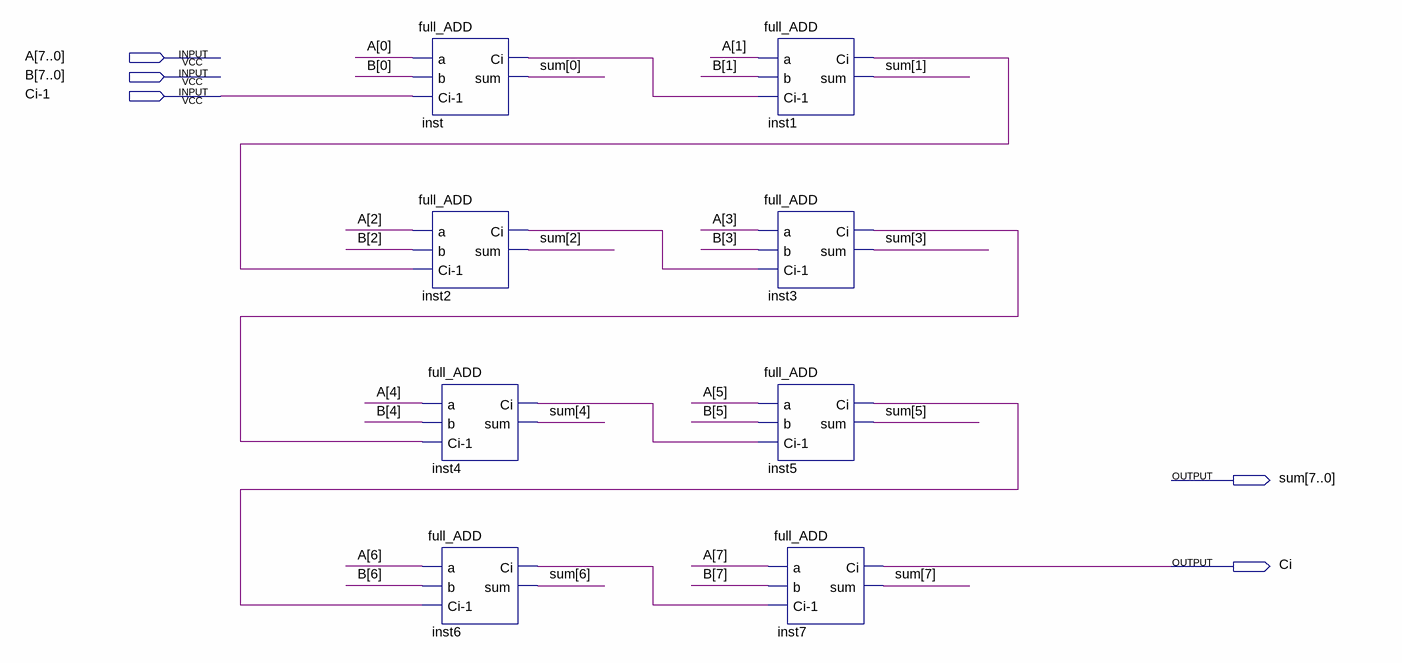
[diagram p0: schematic sheet]
// Quartus schematic 8_ADD.bdf as structural Verilog: 8 symbols, 5 pins
module \8_ADD  (
  input  [7:0] A,
  input  [7:0] B,
  input  \Ci-1 ,
  output [7:0] sum,
  output Ci
);

  wire inst1_ci, inst2_ci, inst3_ci, inst4_ci, inst5_ci, inst6_ci, inst_ci;

  full_ADD inst (.a(A[0]), .b(B[0]), .\Ci-1 (\Ci-1 ), .Ci(inst_ci), .sum(sum[0]));
  full_ADD inst2 (.a(A[2]), .b(B[2]), .\Ci-1 (inst1_ci), .Ci(inst2_ci), .sum(sum[2]));
  full_ADD inst4 (.a(A[4]), .b(B[4]), .\Ci-1 (inst3_ci), .Ci(inst4_ci), .sum(sum[4]));
  full_ADD inst6 (.a(A[6]), .b(B[6]), .\Ci-1 (inst5_ci), .Ci(inst6_ci), .sum(sum[6]));
  full_ADD inst1 (.a(A[1]), .b(B[1]), .\Ci-1 (inst_ci), .Ci(inst1_ci), .sum(sum[1]));
  full_ADD inst3 (.a(A[3]), .b(B[3]), .\Ci-1 (inst2_ci), .Ci(inst3_ci), .sum(sum[3]));
  full_ADD inst5 (.a(A[5]), .b(B[5]), .\Ci-1 (inst4_ci), .Ci(inst5_ci), .sum(sum[5]));
  full_ADD inst7 (.a(A[7]), .b(B[7]), .\Ci-1 (inst6_ci), .Ci(Ci), .sum(sum[7]));
endmodule
